# Altium schematic sheet Connector.SchDoc: Connector
size A4; DrawnBy: AT; SheetNumber: 5; SheetTotal: 5
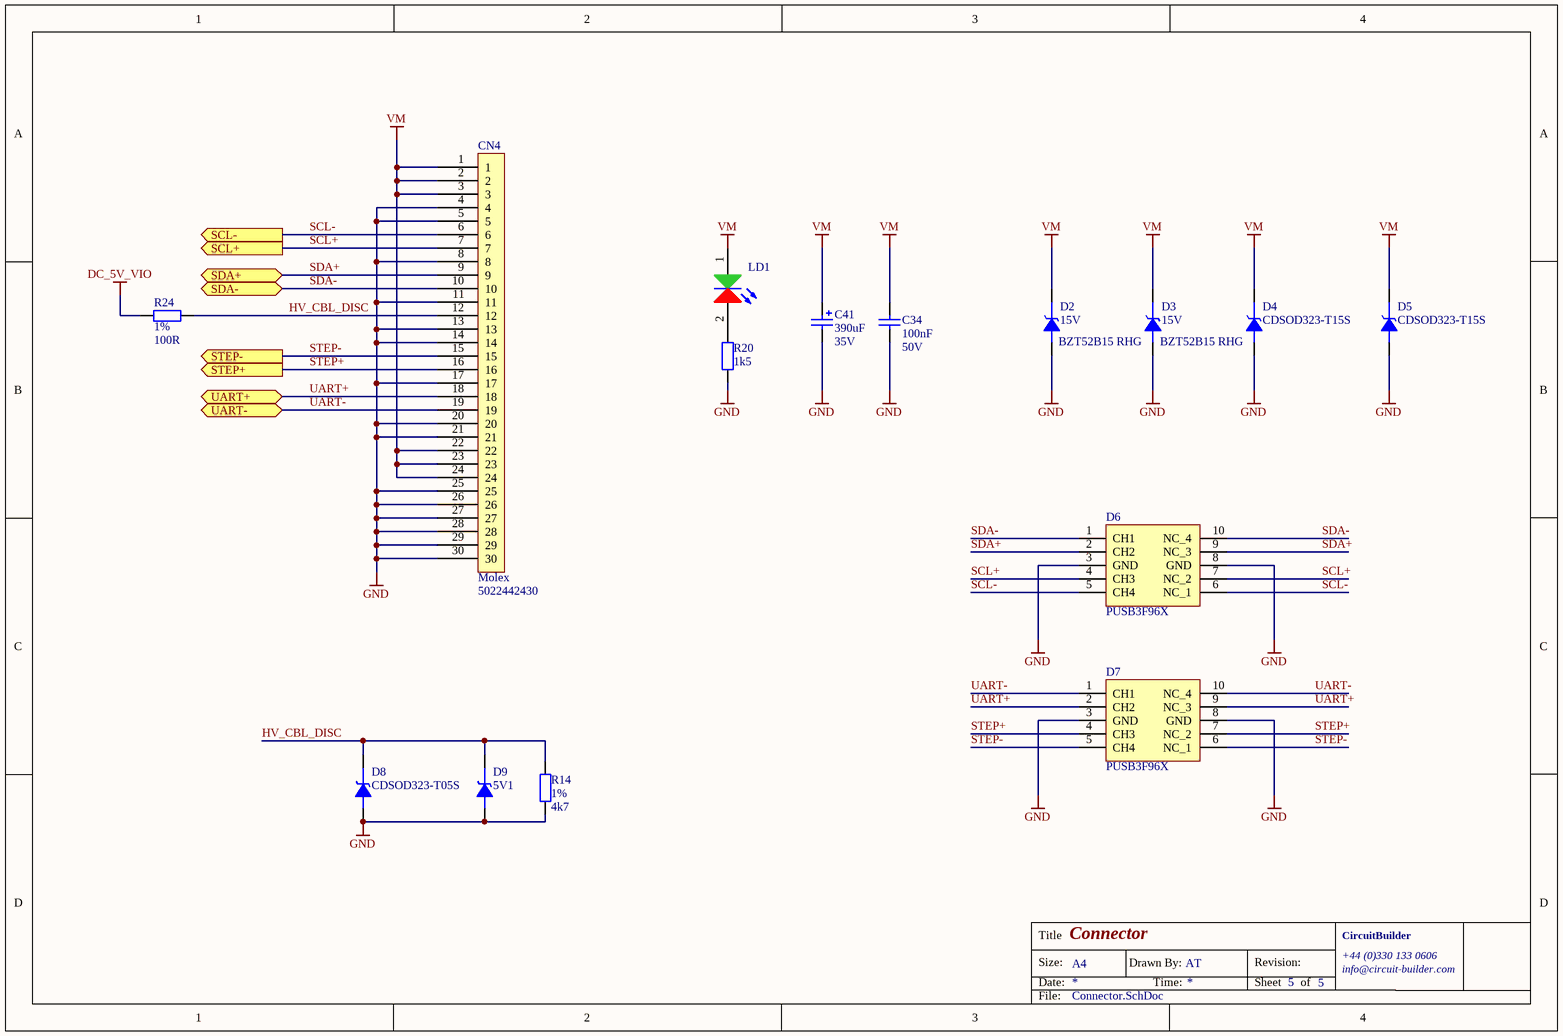
[diagram p0: Connector.SchDoc]

## Parts
C34  value 100nF  Voltage: 50V  [C0603]  (hidden comment: 100nF 0603 Ceramic Capacitor, 10%, X7R, 50V)
C41  value 390uF  Voltage: 35V  [RADIAl-CAN-10MM-DIA]  (hidden comment: HYBRID SMD, 35V390UF 125DEGC 400)
CN4  Manufacturer: Molex  [5022312400]  (hidden comment: 5022442430)
D2  ManufacturerPN: BZT52B15 RHG  Zener Voltage: 15V  [sod-123f]  (hidden comment: AQHV15-01ETG)
D3  ManufacturerPN: BZT52B15 RHG  Zener Voltage: 15V  [sod-123f]  (hidden comment: AQHV15-01ETG)
D4  CDSOD323-T15S  [SOD323]
D5  CDSOD323-T15S  [SOD323]
D6  ManufacturerPN: PUSB3F96X  [DFN2510A-10]  (hidden comment: TVS DIODE 5.5V 4.6V 10DFN2510)
D7  ManufacturerPN: PUSB3F96X  [DFN2510A-10]  (hidden comment: TVS DIODE 5.5V 4.6V 10DFN2510)
D8  CDSOD323-T05S  [SOD323]
D9  Zener Voltage: 5V1  [sod-123f]  (hidden comment: DIODE ZENER 5.1V 500MW SOD123F)
LD1  0805 Red/Green LED  [LED-0805]  (value not drawn)
R14  value 4k7  Tolerance: 1%  [R0603]  (hidden comment: 4k7 0603 Chip Resistor, 1%, 0.1W)
R20  value 1k5  [R0603]  (hidden comment: 1k5 0603 Chip Resistor, 5%, 0.1W)
R24  value 100R  Tolerance: 1%  [R0603]  (hidden comment: 100R 0603 Chip Resistor, 1%, 0.1W)

## Ports
SCL+ (out), SCL- (out), SDA+ (bidir), SDA- (bidir), STEP+ (out), STEP- (out), UART+ (bidir), UART- (bidir)

## Nets
DC_5V_VIO: R24.1
GND: C34.1 C41.- CN4.4 CN4.5 CN4.8 CN4.11 CN4.13 CN4.14 CN4.17 CN4.20 CN4.21 CN4.25 CN4.26 CN4.27 CN4.28 CN4.29 CN4.30 D2.A D3.A D4.2(A) D5.2(A) D6.3(GND) D6.8(GND) D7.3(GND) D7.8(GND) D8.2(A) D9.A R14.1 R20.2
VM: C34.2 C41.+ CN4.1 CN4.2 CN4.3 CN4.22 CN4.23 CN4.24 D2.C D3.C D4.1(C) D5.1(C) LD1.1
HV_CBL_DISC: CN4.12 D8.1(C) D9.C R14.2 R24.2
SCL+: CN4.7 D6.4(CH3) D6.7(NC_2) ; port SCL+
SCL-: CN4.6 D6.5(CH4) D6.6(NC_1) ; port SCL-
SDA+: CN4.9 D6.2(CH2) D6.9(NC_3) ; port SDA+
SDA-: CN4.10 D6.1(CH1) D6.10(NC_4) ; port SDA-
STEP+: CN4.16 D7.4(CH3) D7.7(NC_2) ; port STEP+
STEP-: CN4.15 D7.5(CH4) D7.6(NC_1) ; port STEP-
UART+: CN4.18 D7.2(CH2) D7.9(NC_3) ; port UART+
UART-: CN4.19 D7.1(CH1) D7.10(NC_4) ; port UART-
NetLD1_2: LD1.2 R20.1

## Notes on the sheet
- Title
- Size:
- Date:
- A4
- Drawn By:
- Time:
- Revision:
- Sheet
- of
- CircuitBuilder
- +44 (0)330 133 0606
- info@circuit-builder.com
- File:

## Library data of the parts
C34 = 100nF 0603 Ceramic Capacitor, 10%, X7R, 50V: Manufacturer: AVX; ManufacturerPN: 06035C104KAZ2A; Cost-10000: 0.0192; Supplier1: Farnell; Supplier1PN: 1301894; Cost: 0.0671; Package: 0603; Tolerance: 10%; Supplier2: Open Market; Supplier1PNProto: 1301894
C41 = HYBRID SMD, 35V390UF 125DEGC 400: 390µF 35V Aluminum Polymer Capacitor Radial, Can - SMD 20mOhm 4000 Hrs @ 125°C; Manufacturer: Panasonic Electronic Components; ManufacturerPN: EEH-ZK1V391UP; Cost-10000: 0.608; Tolerance: 20%; Supplier1: Digikey; Supplier1PN: P125001CT-ND; Supplier2: Open Market; Cost: 1.75; Supplier1PNProto: P125001TR-ND
CN4 = 5022442430: 0.5mm Pitch Easy-On FFC/FPC Connector, Horizontal, Surface Mount, ZIF, 24 Circuits; Circuits (maximum): 24; Cost-10000: 0.5; Circuits (Loaded): 24; Mounting Technology: Surface Mount; Number of Rows: 1; Operating Temperature Range: -25°C to +130°C; Supplier1: Digikey; Supplier1PN: WM14450TR-ND; Cost: 1.18; ManufacturerPN: 5022442430; Supplier1PNProto: WM14450CT-ND
D2 D3 = DIODE ZENER 15V 500MW SOD123F: Manufacturer: Taiwan Semiconductor Corporation; Cost-10000: 0.04; Supplier1: Digikey; Supplier1PN: BZT52B15RHGCT-ND; Cost: 0.21; Supplier1PNProto: BZT52B15RHGCT-ND; Package: SOD123F
D4 D5 = CDSOD323-T15S TVS Diode: Manufacturer: Bourns Inc.; Cost-10000: 0.2; ManufacturerPN: CDSOD323-T15S; Supplier1: Digikey; Supplier1PN: CDSOD323-T15STR-ND; Cost: 0.51; Supplier1PNProto: CDSOD323-T15SCT-ND; Package: SOD323
D6 D7 = TVS DIODE 5.5V 4.6V 10DFN2510: 4.6V (Typ) Clamp 5.2A (8/20µs) Ipp Tvs Diode Surface Mount DFN2510A-10; Manufacturer: Nexperia USA Inc.; Cost-10000: 0.10268; Supplier1: Digikey; Supplier1PN: 1727-2030-2-ND; Cost: 0.39; Package: DFN2510A-10; Supplier1PNProto: 1727-2030-1-ND
D8 = CDSOD323-T05S TVS Diode: CDSOD323-T05S Unidirectional TVS Diode; Manufacturer: Bourns Inc.; Cost-10000: 0.2; ManufacturerPN: CDSOD323-T05S; Supplier1: Digikey; Supplier1PN: CDSOD323-T05SCT-ND; Cost: 0.50; Supplier1PNProto: CDSOD323-T05SCT-ND; Package: SOD323
D9 = DIODE ZENER 5.1V 500MW SOD123F: Zener Diode 5.1V 500mW ±2% Surface Mount SOD-123F; Manufacturer: Taiwan Semiconductor Corporation; ManufacturerPN: BZT52B5V1 RHG; Cost-10000: 0.04; Supplier1: Digikey; Supplier1PN: BZT52B5V1RHGCT-ND; Cost: 0.21; Supplier1PNProto: BZT52B5V1RHGCT-ND; Package: SOD123F
LD1 = 0805 Red/Green LED: ManufacturerPN: KPB-2012SURKCGKC; Manufacturer: Kingbright; Cost-10000: 0.1; Supplier1: Farnell; Cost: 0.226; Supplier1PN: 2079908; Supplier1PNProto: 2079908; Value: Red/Green
R14 = 4k7 0603 Chip Resistor, 1%, 0.1W: Manufacturer: Samsung Electro-Mechanics America, Inc; ManufacturerPN: RC1608F472CS; Flex Part Number: ROL-F130-1087; Cost-10000: 0.00099; Supplier1: Digikey; Supplier1PN: 1276-3502-2-ND; Cost: 0.07; Supplier2: Open Market; Supplier1PNProto: 1276-3502-1-ND
R20 = 1k5 0603 Chip Resistor, 5%, 0.1W: Manufacturer: Samsung Electro-Mechanics America, Inc; ManufacturerPN: RC1608J152CS; Flex Part Number: RES0016; Cost-10000: 0.00077; Supplier1: Digikey; Supplier1PN: 1276-5066-2-ND; Cost: 0.00089; Supplier2: Open Market; Supplier1PNProto: 1276-5066-1-ND; Tolerance: 5%
R24 = 100R 0603 Chip Resistor, 1%, 0.1W: Manufacturer: Yageo; ManufacturerPN: RC0603FR-07100RL; Cost-10000: 0.003; ProductionCost: 0.0016; Supplier1: Digikey; Supplier1PN: 311-100HRTR-ND; Cost: 0.08; Supplier2: Open Market; Supplier1PNProto: 311-100HRCT-ND; ProductionSupplier: LCSC; ProductionSupplierPN: C105588